# Altium schematic sheet 3.dwm3000.SchDoc
size A4; Organization: ORGANIZATION; Address1: ADDRESS 1; Address2: ADDRESS 2; Address3: ADDRESS 3; Address4: ADDRESS 4; DocumentNumber: 4; SheetNumber: 4; SheetTotal: 5; ENG_APP_DATE: --/--/--; DSN_APP_DATE: --/--/--; CHK_APP_DATE: --/--/--; Page: DWM3000
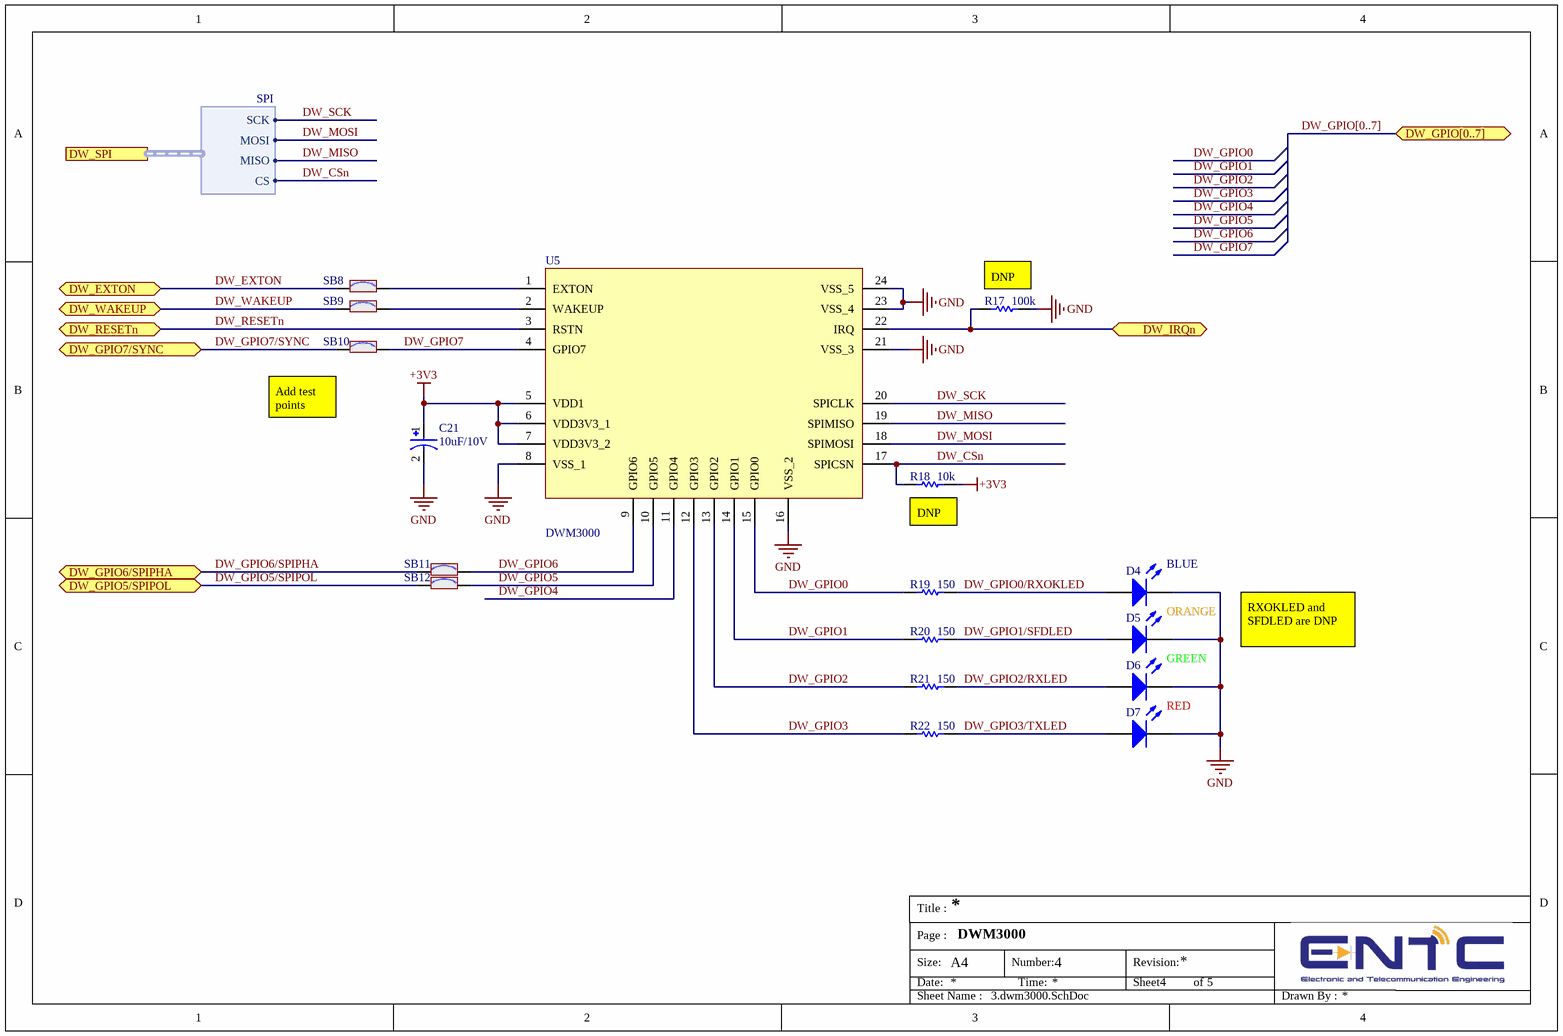
[diagram p0: 3.dwm3000.SchDoc]

## Parts
C21  10uF/10V  [cap0805]
D4  BLUE  [LED0805]
D5  ORANGE  [LED0805]
D6  GREEN  [LED0805]
D7  RED  [LED0805]
R17  100k  [RES0805]
R18  10k  [RES0805]
R19  150  [RES0805]
R20  150  [RES0805]
R21  150  [RES0805]
R22  150  [RES0805]
SB8  SB_ON  [SOLDER-BRIDGE_R0603-0R]  (value not drawn)
SB9  SB_ON  [SOLDER-BRIDGE_R0603-0R]  (value not drawn)
SB10  SB_ON  [SOLDER-BRIDGE_R0603-0R]  (value not drawn)
SB11  SB_ON  [SOLDER-BRIDGE_R0603-0R]  (value not drawn)
SB12  SB_ON  [SOLDER-BRIDGE_R0603-0R]  (value not drawn)
U5  DWM3000  [DWM3000]

## Ports
DW_EXTON (bidir), DW_GPIO5/SPIPOL (bidir), DW_GPIO6/SPIPHA (bidir), DW_GPIO7/SYNC (bidir), DW_GPIO[0..7] (bidir), DW_IRQn (bidir), DW_RESETn (bidir), DW_SPI (harness SPI), DW_WAKEUP (bidir)

## Harnesses
SPI: CS, MISO, MOSI, SCK

## Nets
+3V3: C21.1 R18.2 U5.5(VDD1) U5.6(VDD3V3_1) U5.7(VDD3V3_2)
GND: C21.2 D4.2(K) D5.2(K) D6.2(K) D7.2(K) R17.1 U5.8(VSS_1) U5.16(VSS_2) U5.21(VSS_3) U5.23(VSS_4) U5.24(VSS_5)
DW_CSn: R18.1 U5.17(SPICSN) ; port DW_SPI.CS
DW_EXTON: SB8.1 ; port DW_EXTON
DW_GPIO0: R19.2 U5.15(GPIO0)
DW_GPIO0/RXOKLED: D4.1(A) R19.1
DW_GPIO1: R20.2 U5.14(GPIO1)
DW_GPIO1/SFDLED: D5.1(A) R20.1
DW_GPIO2: R21.2 U5.13(GPIO2)
DW_GPIO2/RXLED: D6.1(A) R21.1
DW_GPIO3: R22.2 U5.12(GPIO3)
DW_GPIO3/TXLED: D7.1(A) R22.1
DW_GPIO4: U5.11(GPIO4)
DW_GPIO5: SB12.2 U5.10(GPIO5)
DW_GPIO5/SPIPOL: SB12.1 ; port DW_GPIO5/SPIPOL
DW_GPIO6: SB11.2 U5.9(GPIO6)
DW_GPIO6/SPIPHA: SB11.1 ; port DW_GPIO6/SPIPHA
DW_GPIO7: SB10.2 U5.4(GPIO7)
DW_GPIO7/SYNC: SB10.1 ; port DW_GPIO7/SYNC
DW_IRQn: R17.2 U5.22(IRQ) ; port DW_IRQn
DW_MISO: U5.19(SPIMISO) ; port DW_SPI.MISO
DW_MOSI: U5.18(SPIMOSI) ; port DW_SPI.MOSI
DW_RESETn: U5.3(RSTN) ; port DW_RESETn
DW_SCK: U5.20(SPICLK) ; port DW_SPI.SCK
DW_WAKEUP: SB9.1 ; port DW_WAKEUP
NetSB8_2: SB8.2 U5.1(EXTON)
NetSB9_2: SB9.2 U5.2(WAKEUP)

## Buses and harness runs
bus DW_GPIO[0..7] = port DW_GPIO[0..7]

## Notes on the sheet
- (near R17) DNP
- (near SB10) Add test points
- (near R18) DNP
- RXOKLED and SFDLED are DNP
- Title :
- Size:
- Date:
- Page :
- A4
- Number:
- Time:
- Revision:
- Sheet
- of
- Sheet Name :
- Drawn By :

## Library data of the parts
C21 = Cap Pol: 10V 10uF X7R ±10% 0805 Multilayer Ceramic Capacitors MLCC - SMD/SMT ROHS; MF: Murata Electronics; MP: GRM21BR71A106KE51L; JLCPCB: C86038
D4 D5 = LED: Light Emitting Diode; MF: *
D6 = LED: Yellow Green 0805 LED Indication - Discrete ROHS; MF: BrtLed(Bright LED Elec); MP: BL-HGE35A-AV-TRB; JLCPCB: C165984
D7 = LED: Light Emitting Diode; MF: BrtLed(Bright LED Elec); MP: BL-HUF35A-AV-TRB; JLCPCB: C94741
R17 = Res: ±1% 100kΩ 0805 Chip Resistor - Surface Mount ROHS; MF: UNI-ROYAL(Uniroyal Elec); MP: 0805W8F1003T5E; JLCPCB: C17407
R18 = Res: 125mW Thick Film Resistors 150V ±100ppm/℃ ±1% 10kΩ 0805 Chip Resistor - Surface Mount ROHS; MF: UNI-ROYAL(Uniroyal Elec); MP: 0805W8F1002T5E; JLCPCB: C17414
R19-R22 = Res: 125mW Thick Film Resistors 150V ±100ppm/℃ ±1% 150Ω 0805 Chip Resistor - Surface Mount ROHS; MF: UNI-ROYAL(Uniroyal Elec); MP: 0805W8F1500T5E; JLCPCB: C17471
SB8-SB12 = SB_ON: 100mW Thick Film Resistors 75V ±5% ±800ppm/℃ 0Ω 0603 Chip Resistor - Surface Mount ROHS; MF: UNI-ROYAL(Uniroyal Elec); MP: 0603WAJ0000T5E; JLCPCB: C15402
U5 = DWM3000: RF Modules DWM3000 UWB XCVR Module; MP: DWM3000TR13; MF: Qorvo; MOUSER: 772-DWM3000TR13